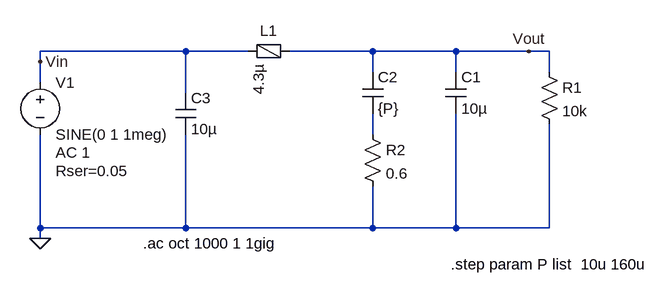
[diagram p0: schematic ferrite_bead_response.asc]
ferrite_bead_response.asc, the LTspice schematic file:
Version 4
SHEET 1 880 680
WIRE -144 64 -368 64
WIRE -48 64 -144 64
WIRE 144 64 16 64
WIRE 272 64 144 64
WIRE 384 64 272 64
WIRE 416 64 384 64
WIRE -368 80 -368 64
WIRE 144 96 144 64
WIRE 272 96 272 64
WIRE 416 96 416 64
WIRE -368 112 -368 80
WIRE -144 128 -144 64
WIRE 144 192 144 160
WIRE -368 336 -368 192
WIRE -144 336 -144 192
WIRE -144 336 -368 336
WIRE 144 336 144 272
WIRE 144 336 -144 336
WIRE 272 336 272 160
WIRE 272 336 144 336
WIRE 416 336 416 176
WIRE 416 336 272 336
WIRE -368 352 -368 336
FLAG 384 64 Vout
FLAG -368 80 Vin
FLAG -368 352 0
SYMBOL cap 256 96 R0
SYMATTR InstName C1
SYMATTR Value 10µ
SYMATTR SpiceLine V=25 Irms=0 Rser=0.001 Lser=0
SYMBOL res 400 80 R0
SYMATTR InstName R1
SYMATTR Value 10k
SYMBOL FerriteBead -16 64 R90
WINDOW 0 -16 0 VBottom 2
SYMATTR InstName L1
SYMATTR Value 4.3µ
SYMATTR SpiceLine Ipk=7 Rser=0.00678 Rpar=7000 Cpar=3.1p mfg="Würth Elektronik" pn="742792904 WE-PF 1280"
SYMBOL voltage -368 96 R0
WINDOW 123 24 124 Left 2
WINDOW 39 24 152 Left 2
SYMATTR InstName V1
SYMATTR Value SINE(0 1 1meg)
SYMATTR Value2 AC 1
SYMATTR SpiceLine Rser=0.05
SYMBOL cap 128 96 R0
SYMATTR InstName C2
SYMATTR Value {P}
SYMATTR SpiceLine V=25 Irms=0 Rser=0.001 Lser=0
SYMBOL res 128 176 R0
SYMATTR InstName R2
SYMATTR Value 0.6
SYMBOL cap -160 128 R0
SYMATTR InstName C3
SYMATTR Value 10µ
TEXT -210 360 Left 2 !.ac oct 1000 1 1gig
TEXT 264 392 Left 2 !.step param P list  10u 160u

The netlist it stands for:
* ferrite_bead_response.asc
C1 Vout 0 10µ V=25 Irms=0 Rser=0.001 Lser=0
R1 Vout 0 10k
L1 Vout Vin 4.3µ Ipk=7 Rser=0.00678 Rpar=7000 Cpar=3.1p mfg="Würth Elektronik" pn="742792904 WE-PF 1280"
V1 Vin 0 SINE(0 1 1meg) AC 1 Rser=0.05
C2 Vout N001 {P} V=25 Irms=0 Rser=0.001 Lser=0
R2 N001 0 0.6
C3 Vin 0 10µ
.ac oct 1000 1 1gig
.step param P list  10u 160u
.backanno
.end